# Altium schematic sheet USB-C.SchDoc
size A; SheetNumber: 2; SheetTotal: 6
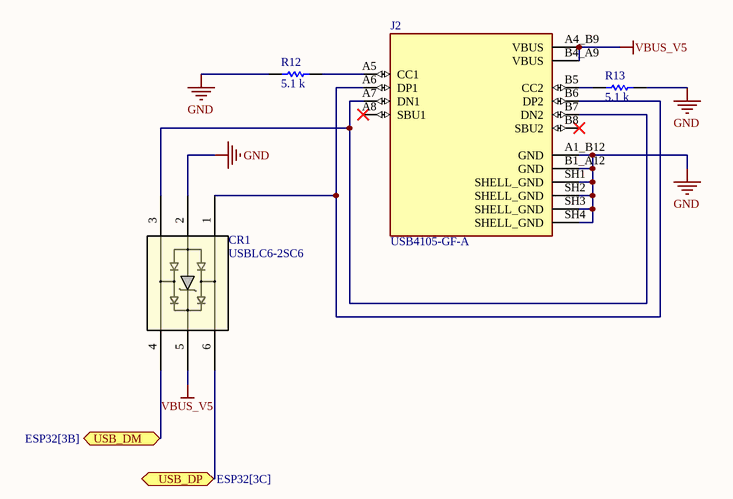
[diagram p0: USB-C.SchDoc]

## Parts
CR1  USBLC6-2SC6  [SOT23-6L_STM]
J2  USB4105-GF-A  [GCT_USB4105-GF-A]
R12  value 5.1 k  [RES 0805_2012]  (hidden comment: Resistor)
R13  value 5.1 k  [RES 0805_2012]  (hidden comment: Resistor)

## Ports
USB_DM (bidir, see ESP32[3B]), USB_DP (bidir, see ESP32[3C])

## Nets
GND: CR1.2 J2.A1_B12(GND) J2.B1_A12(GND) J2.SH1(SHELL_GND) J2.SH2(SHELL_GND) J2.SH3(SHELL_GND) J2.SH4(SHELL_GND) R12.1 R13.2
VBUS_V5: CR1.5 J2.A4_B9(VBUS) J2.B4_A9(VBUS)
USB_DM: CR1.4 ; port USB_DM
USB_DP: CR1.6 ; port USB_DP
NetCR1_1: CR1.1 J2.A6(DP1) J2.B6(DP2)
NetCR1_3: CR1.3 J2.A7(DN1) J2.B7(DN2)
NetJ2_A5: J2.A5(CC1) R12.2
NetJ2_B5: J2.B5(CC2) R13.1

Not connected (* = marked no-connect by the designer): J2 A8(SBU1)* B8(SBU2)*

## Notes on the sheet
- Title:
- Date:
- Size:
- A3
- Number:
- Institution:
- Universidad Anáhuac Querétaro
- Drawn by:
- Marco Antonio Guereca Soto
- Check by:
- Morrison Ernesto Rodríguez Gutiérrez

## Library data of the parts
CR1 = USBLC6-2SC6: ESD Protection for USB 2.0 High Speed; Manufacturer_Name: STMicroelectronics; Copyright: Copyright (C) 2025 Ultra Librarian. All rights reserved.; Manufacturer_Part_Number: USBLC6-2SC6; RefDes: RefDes; Type: Type
J2 = USB4105-GF-A: MF: {'manufacturer': u'GCT'}; Package: None; Price: None; Value: *; MP: USB4105-GF-A; Availability: Unavailable
R12 R13 = Resistor: TC1: 0; SimulationGenericComponent: True; TC2: 0